# EAGLE schematic FDC_Schematic (1) (EAGLE 8.2.2)
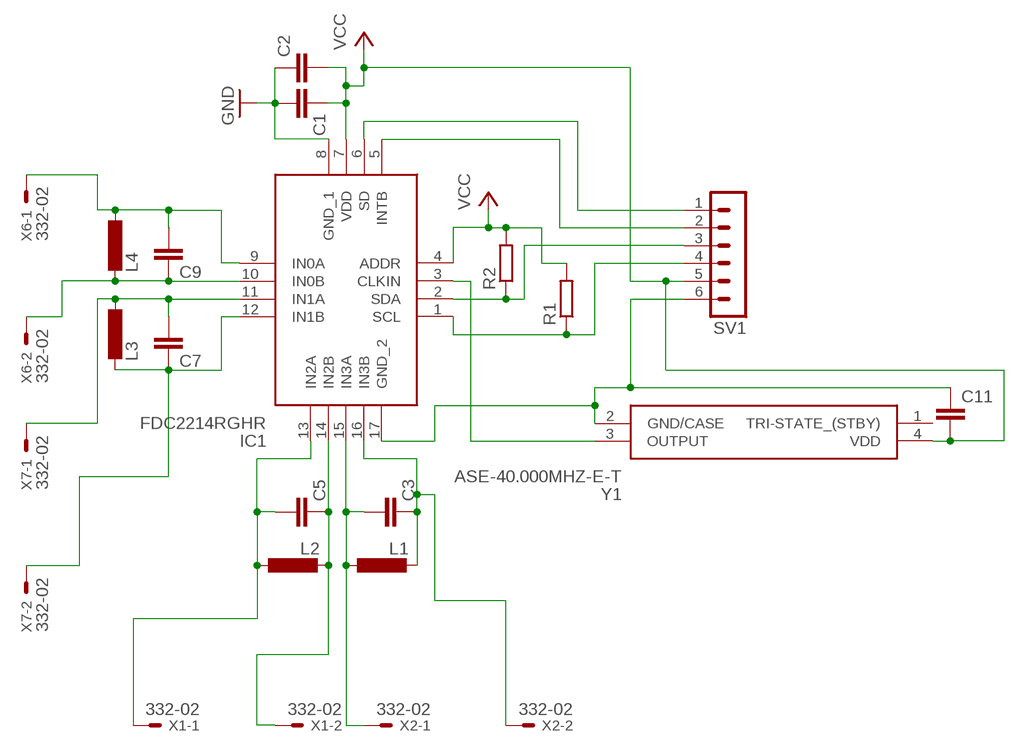
[diagram p0: schematic, sheet 1]

## Parts
C1  C-EUC0805  [C0805]
C2  C-EUC0805  [C0805]
C3  C-EUC0805  [C0805]
C5  C-EUC0805  [C0805]
C7  C-EUC0805  [C0805]
C9  C-EUC0805  [C0805]
C11  C-EUC0805  [C0805]
IC1  FDC2214RGHR  [QFN50P400X400X80-17N]
L1  L-EUL8530M  [L8530M]
L2  L-EUL8530M  [L8530M]
L3  L-EUL8530M  [L8530M]
L4  L-EUL8530M  [L8530M]
R1  R-EU_R0805  [R0805]
R2  R-EU_R0805  [R0805]
SV1  MA06-1  [MA06-1]
X1  332-02  [332-02]
X2  332-02  [332-02]
X6  332-02  [332-02]
X7  332-02  [332-02]
Y1  ASE-40.000MHZ-E-T  [ASE40000MHZET]

## Nets
GND: C1.2 C2.1 C11.1 IC1.8(GND_1) IC1.17(GND_2) SV1.6 Y1.2(GND/CASE)
N$1: C3.2 IC1.15(IN3A) L1.1 X2.1
N$3: IC1.1(SCL) R1.1 SV1.4
N$4: IC1.6(SD) SV1.1
N$5: IC1.5(INTB) SV1.2
N$6: C5.2 IC1.13(IN2A) L2.1 X1.1
N$7: C7.1 IC1.12(IN1B) L3.2 X7.2
N$8: C5.1 IC1.14(IN2B) L2.2 X1.2
N$10: IC1.3(CLKIN) Y1.3(OUTPUT)
N$11: IC1.2(SDA) R2.1 SV1.3
N$12: C7.2 IC1.11(IN1A) L3.1 X7.1
N$13: C3.1 IC1.16(IN3B) L1.2 X2.2
N$14: C9.2 IC1.9(IN0A) L4.1 X6.1
N$15: C9.1 IC1.10(IN0B) L4.2 X6.2
VCC: C1.1 C2.2 C11.2 IC1.4(ADDR) IC1.7(VDD) R1.2 R2.2 SV1.5 Y1.4(VDD)
Unconnected: Y1.1(TRI-STATE_(STBY))

## Library data of the parts
C1-C3 C5 C7 C9 C11 = rcl:C-EU: CAPACITOR, European symbol
IC1 = SamacSys_Parts:FDC2214RGHR: Proximity Sensors 4-Ch, 28-bit, capacitance to digital converter 16-WQFN -40 to 125 Source: Datasheet <https://www.ti.com/lit/ds/symlink/fdc2214.pdf?ts=1640752815986&ref_url=https%3A%2F%2Fwww.ti.com%2Fstore%2Fti%2Fen%2Fp%2Fproduct%2F%3Fp%3DFDC2214RGHR>; ARROW_PART_NUMBER: FDC2214RGHR; ARROW_PRICE-STOCK: null?utm_currency=USD&region=nac; DESCRIPTION: Proximity Sensors 4-Ch, 28-bit, capacitance to digital converter 16-WQFN -40 to 125; HEIGHT: 0.8mm; MANUFACTURER_NAME: Texas Instruments; MANUFACTURER_PART_NUMBER: FDC2214RGHR; MOUSER_PART_NUMBER: 595-FDC2214RGHR; MOUSER_PRICE-STOCK: https://www.mouser.co.uk/ProductDetail/Texas-Instruments/FDC2214RGHR?qs=GJ%2F2ZGcr5uPBUC9HQa0OnA%3D%3D
L1-L4 = rcl:L-EU: INDUCTOR, European symbol
R1 R2 = rcl:R-EU_: RESISTOR, European symbol
SV1 = con-lstb:MA06-1: PIN HEADER; OC_FARNELL: unknown; OC_NEWARK: unknown
X1 X2 X6 X7 = con-garry:332-02: 2 Pin - 2mm Dual Row Source: www.mpe-connector.de / garry_shortform_2012.pdf
Y1 = ASE-40.000MHz-E-T:ASE-40.000MHZ-E-T: Standard Clock Oscillators XTAL OSC XO 40.0000MHZ CMOS SMD Source: Datasheet <https://abracon.com/Oscillators/ASEseries.pdf>; DESCRIPTION: Standard Clock Oscillators XTAL OSC XO 40.0000MHZ CMOS SMD; HEIGHT: 1.2mm; MANUFACTURER_NAME: ABRACON; MANUFACTURER_PART_NUMBER: ASE-40.000MHz-E-T; MOUSER_PART_NUMBER: 815-ASE-40.0M-E-T; MOUSER_PRICE-STOCK: https://www.mouser.co.uk/ProductDetail/ABRACON/ASE-40000MHz-E-T?qs=s46Hw6dZPL6mQ8%2FGISl7aQ%3D%3D